# Altium schematic sheet SolarPowerBank.SchDoc
size A3; SheetNumber: 1; SheetTotal: 1
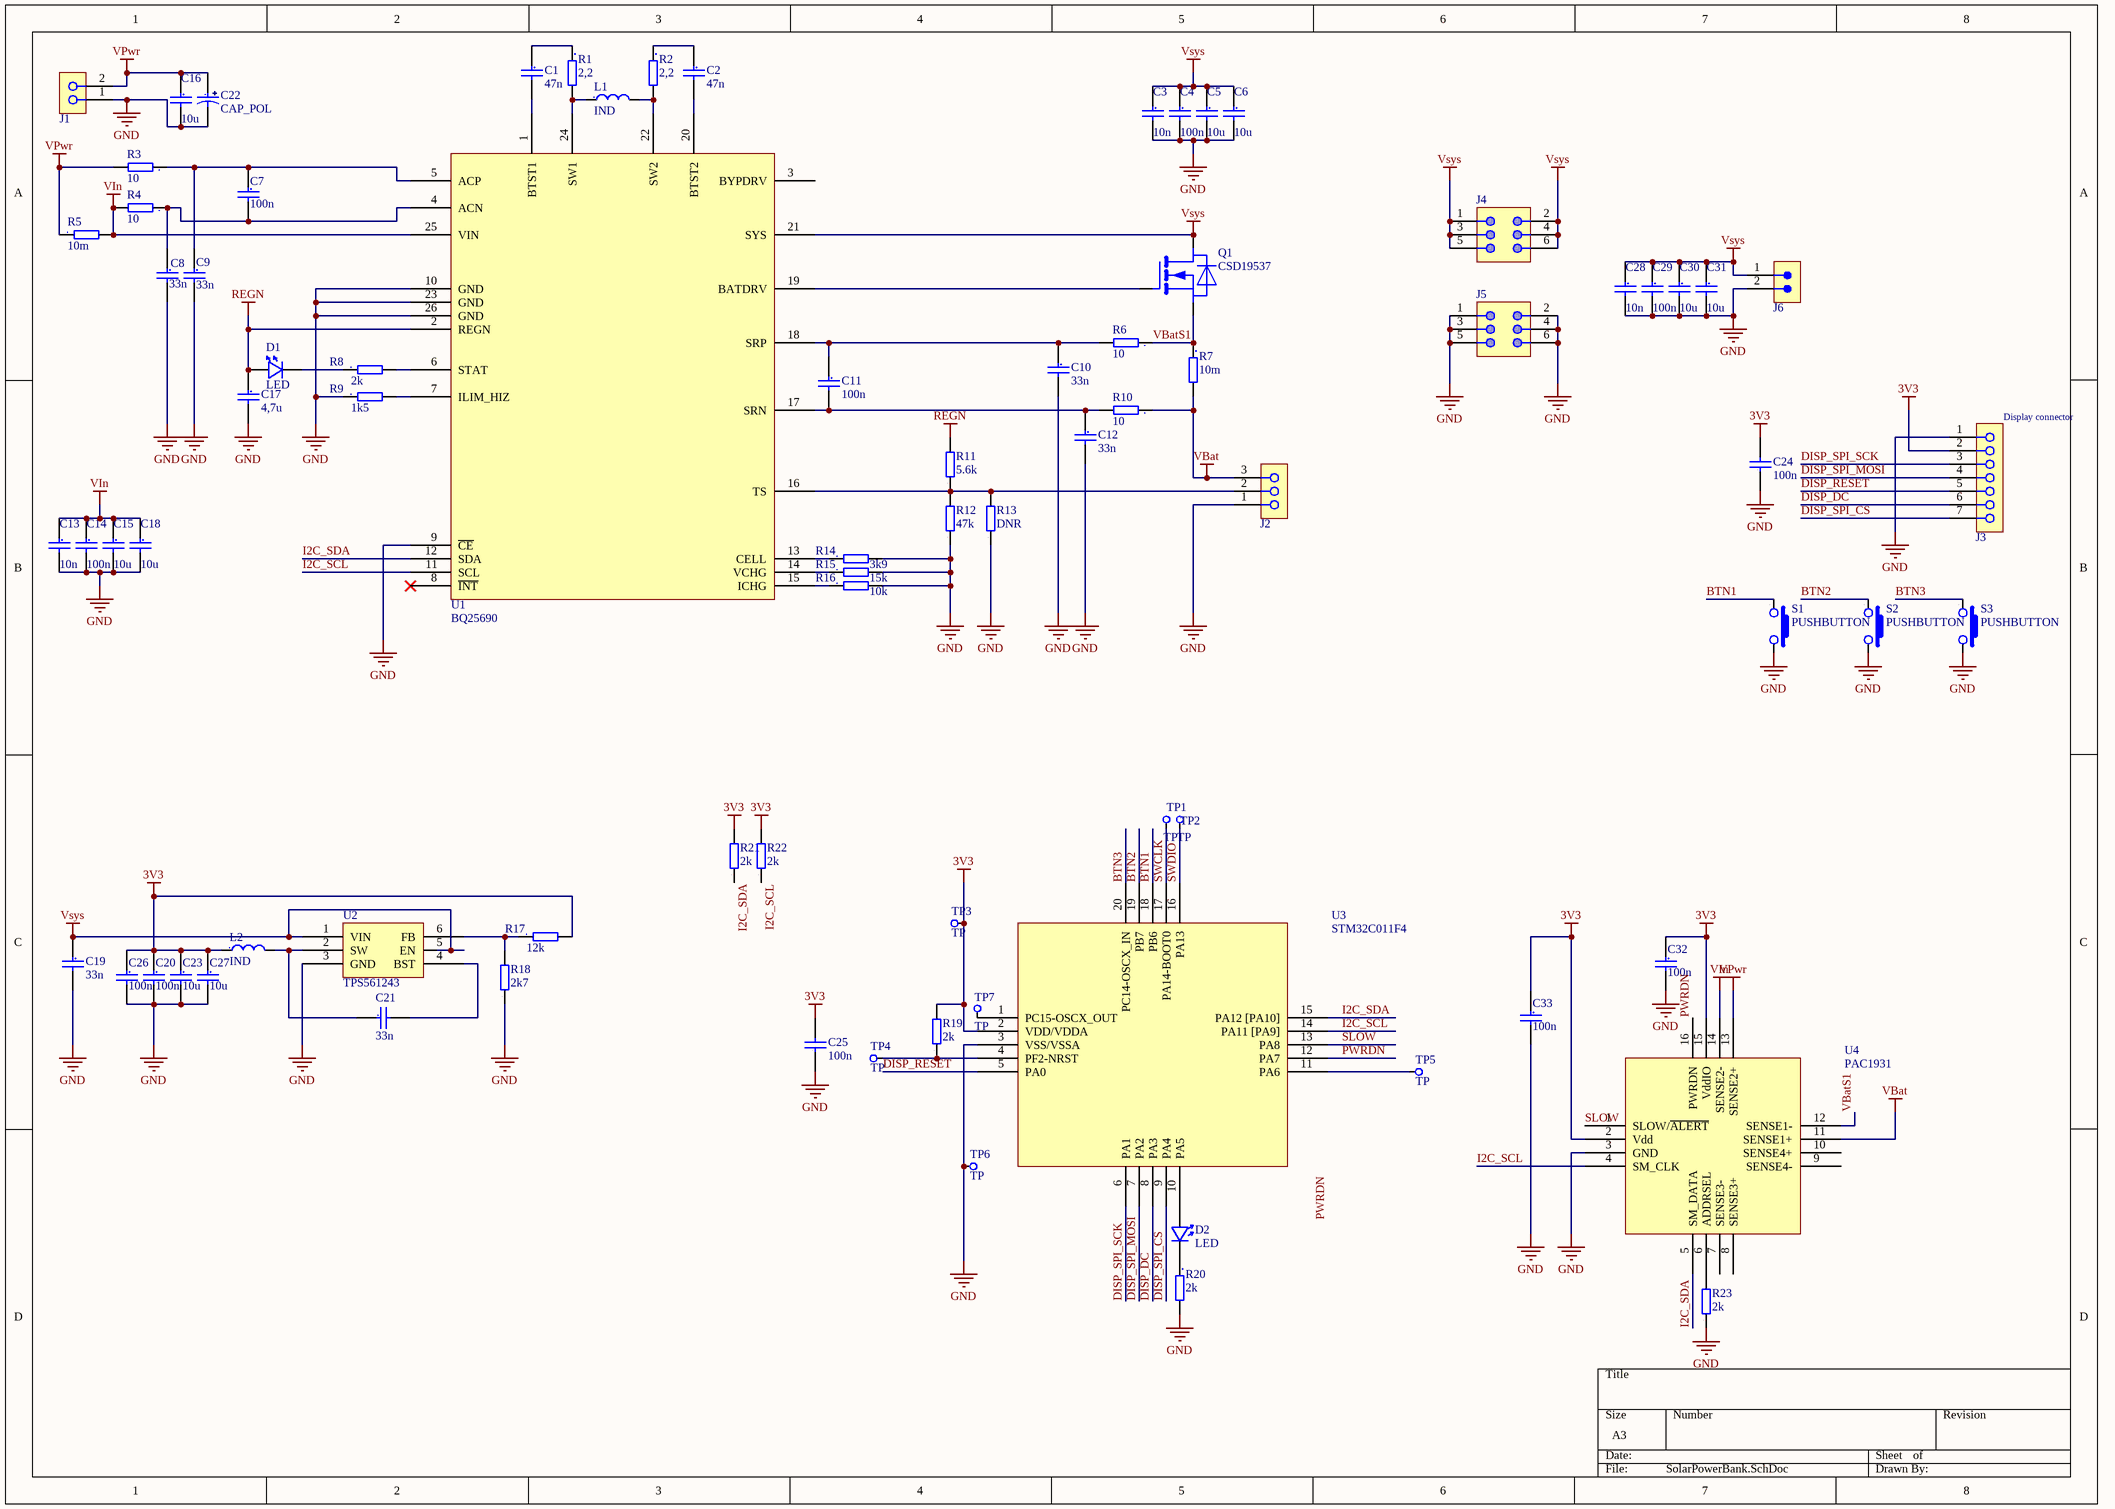
[diagram p0: SolarPowerBank.SchDoc]

## Parts
C1  47n  [C0402_N]
C2  47n  [C0402_N]
C3  10n  [C0805_N]
C4  100n  [C0805_N]
C5  10u  [C0805_N]
C6  10u  [C0805_N]
C7  100n  [C0402_N]
C8  33n  [C0402_N]
C9  33n  [C0402_N]
C10  33n  [C0603_N]
C11  100n  [C0402_N]
C12  33n  [C0603_N]
C13  10n  [C0805_N]
C14  100n  [C0805_N]
C15  10u  [C0805_N]
C16  10u  [C0805_N]
C17  4,7u  [C0402_N]
C18  10u  [C0805_N]
C19  33n  [C0402_N]
C20  100n  [C0402_N]
C21  33n  [C0402_N]
C22  CAP_POL  [C592D_D]
C23  10u  [C0603_N]
C24  100n  [C0402_N]
C25  100n  [C0402_N]
C26  100n  [C0402_N]
C27  10u  [C0603_N]
C28  10n  [C0805_N]
C29  100n  [C0805_N]
C30  10u  [C0805_N]
C31  10u  [C0805_N]
C32  100n  [C0402_N]
C33  100n  [C0402_N]
D1  LED  [LED_0603]
D2  LED  [LED_0603]
J1  (no value)  [TERM_BLOCK_2x1]
J2  (no value)  [TERM_BLOCK_CONNECTOR_3x1]
J3  Display connector  [PINSOCK_7X1_THT]
J4  (no value)  [PINHDR_3X2_THT_2,54]
J5  (no value)  [PINHDR_3X2_THT_2,54]
J6  (no value)  [S2B-XH-A-1]
L1  IND  [SNR5040]
L2  IND  [IND_2520]
Q1  CSD19537  [PowerPAK]
R1  2,2  [R0402_N]
R2  2,2  [R0402_N]
R3  10  [R0402_N]
R4  10  [R0402_N]
R5  10m  [R2512_Wide]
R6  10  [R0402_N]
R7  10m  [R2512_Wide]
R8  2k  [R0402_N]
R9  1k5  [R0402_N]
R10  10  [R0402_N]
R11  5.6k  [R0402_N]
R12  47k  [R0402_N]
R13  DNR  [R0402_N]
R14  3k9  [R0402_N]
R15  15k  [R0402_N]
R16  10k  [R0402_N]
R17  12k  [R0402_N]
R18  2k7  [R0402_N]
R19  2k  [R0402_N]
R20  2k  [R0402_N]
R21  2k  [R0402_N]
R22  2k  [R0402_N]
R23  2k  [R0402_N]
S1  PUSHBUTTON  [DTSM-3]
S2  PUSHBUTTON  [DTSM-3]
S3  PUSHBUTTON  [DTSM-3]
TP1  TP  [TP_1MM]  (no BOM)
TP2  TP  [TP_1MM]  (no BOM)
TP3  TP  [TP_1MM]  (no BOM)
TP4  TP  [TP_1MM]  (no BOM)
TP5  TP  [TP_1MM]  (no BOM)
TP6  TP  [TP_1MM]  (no BOM)
TP7  TP  [TP_1MM]  (no BOM)
U1  BQ25690  [WQFN-HR-26]
U2  TPS561243  [SOT-563]
U3  STM32C011F4  [UFQFPN20]
U4  PAC1931  [UQFN-16]

## Nets
3V3: C20.1 C23.1 C24.2 C25.2 C26.1 C27.1 C32.1 C33.1 J3.2 L2.1 R17.2 R19.2 R21.2 R22.2 TP3.1 U3.2(VDD/VDDA) U4.2(Vdd) U4.15(VddIO)
GND: C3.2 C4.2 C5.2 C6.2 C8.2 C9.2 C10.2 C12.2 C13.2 C14.2 C15.2 C16.2 C17.2 C18.2 C19.2 C20.2 C22.N C23.2 C24.1 C25.1 C26.2 C27.2 C28.2 C29.2 C30.2 C31.2 C32.2 C33.2 J1.1 J2.1 J3.1 J5.1 J5.2 J5.3 J5.4 J5.5 J5.6 J6.2 R9.1 R12.1 R13.1 R14.2 R15.2 R16.2 R18.1 R20.2 R23.1 S1.2 S2.2 S3.2 TP6.1 U1.9(~{CE}) U1.10(GND) U1.23(GND) U1.26(GND) U2.3(GND) U3.3(VSS/VSSA) U4.3(GND)
REGN: C17.1 D1.A R11.2 U1.2(REGN)
VBat: J2.3 R7.2 R10.1 U4.11(SENSE1+)
VIn: C13.1 C14.1 C15.1 C18.1 R4.2 R5.2 U1.25(VIN) U4.14(SENSE2-)
VPwr: C16.1 C22.P J1.2 R3.2 R5.1 U4.13(SENSE2+)
Vsys: C3.1 C4.1 C5.1 C6.1 C19.1 C28.1 C29.1 C30.1 C31.1 J4.1 J4.2 J4.3 J4.4 J4.5 J4.6 J6.1 Q1.D U1.21(SYS) U2.1(VIN) U2.5(EN)
BTN1: S1.1 U3.18(PB6)
BTN2: S2.1 U3.19(PB7)
BTN3: S3.1 U3.20(PC14-OSCX_IN)
DISP_DC: J3.6 U3.8(PA3)
DISP_RESET: J3.5 U3.5(PA0)
DISP_SPI_CS: J3.7 U3.9(PA4)
DISP_SPI_MOSI: J3.4 U3.7(PA2)
DISP_SPI_SCK: J3.3 U3.6(PA1)
I2C_SCL: R22.1 U1.11(SCL) U3.14(PA11_[PA9]) U4.4(SM_CLK)
I2C_SDA: R21.1 U1.12(SDA) U3.15(PA12_[PA10]) U4.5(SM_DATA)
PWRDN: U3.12(PA7) U4.16(PWRDN)
SLOW: U3.13(PA8) U4.1(SLOW/~{ALERT})
SWCLK: TP1.1 U3.17(PA14-BOOT0)
SWDIO: TP2.1 U3.16(PA13)
VBatS1: Q1.S R6.1 R7.1 U4.12(SENSE1-)
NetC1_1: C1.1 R1.1
NetC1_2: C1.2 U1.1(BTST1)
NetC2_1: C2.1 R2.1
NetC2_2: C2.2 U1.20(BTST2)
NetC7_1: C7.1 C9.1 R3.1 U1.5(ACP)
NetC7_2: C7.2 C8.1 R4.1 U1.4(ACN)
NetC10_1: C10.1 C11.1 R6.2 U1.18(SRP)
NetC11_2: C11.2 C12.1 R10.2 U1.17(SRN)
NetC21_1: C21.1 L2.2 U2.2(SW)
NetC21_2: C21.2 U2.4(BST)
NetD1_K: D1.K R8.1
NetD2_A: D2.A U3.10(PA5)
NetD2_K: D2.K R20.1
NetJ2_2: J2.2 R11.1 R12.2 R13.2 U1.16(TS)
NetL1_1: L1.1 R1.2 U1.24(SW1)
NetL1_2: L1.2 R2.2 U1.22(SW2)
NetQ1_G: Q1.G U1.19(BATDRV)
NetR8_2: R8.2 U1.6(STAT)
NetR9_2: R9.2 U1.7(ILIM_HIZ)
NetR14_1: R14.1 U1.13(CELL)
NetR15_1: R15.1 U1.14(VCHG)
NetR16_1: R16.1 U1.15(ICHG)
NetR17_1: R17.1 R18.2 U2.6(FB)
NetR19_1: R19.1 TP4.1 U3.4(PF2-NRST)
NetR23_2: R23.2 U4.6(ADDRSEL)
NetTP5_1: TP5.1 U3.11(PA6)
NetTP7_1: TP7.1 U3.1(PC15-OSCX_OUT)

Not connected (* = marked no-connect by the designer): U1 3(BYPDRV) 8(~{INT})*; U4 7(SENSE3-) 8(SENSE3+) 9(SENSE4-) 10(SENSE4+)

## Notes on the sheet
- Labels drawn without touching a wire or pin: PWRDN

## Library data of the parts
C1-C21 C23-C33 = CAP: RevS: $Rev:: 58        $
C22 = CAP_POL: RevS: $Rev:: 58        $
J1 = SOCHDR_2X1: Socket; ComponentLink1Description: Manufacturer; ComponentLink1URL: http://www.we-online.de; ComponentLink2Description: Datasheet; ComponentLink2URL: http://katalog.we-online.de/em/datasheet/691412320002.pdf
J2 = SOCHDR_3X1: Socket; ComponentLink1Description: Manufacturer; ComponentLink1URL: http://www.we-online.de; ComponentLink2Description: Datasheet; ComponentLink2URL: http://katalog.we-online.de/em/datasheet/691412320002.pdf
J3 = SOCHDR_7X1: Socket; ComponentLink1Description: Manufacturer; ComponentLink1URL: http://www.we-online.de; ComponentLink2Description: Datasheet; ComponentLink2URL: http://katalog.we-online.de/em/datasheet/691412320002.pdf
J4 J5 = PINHDR_3x2
J6 = PINHDR_2X1: Socket; ComponentLink1Description: Manufacturer; ComponentLink1URL: http://www.we-online.de; ComponentLink2Description: Datasheet; ComponentLink2URL: http://katalog.we-online.de/em/datasheet/691412320002.pdf
L1 L2 = IND: Inductor
Q1 = MOSFET_N
R1-R23 = RES
U1 = BQ25690: Standalone/I2C Controlled, 34V, 1- to 7-Cell Li-Ion, 3A Buck-Boost Bidirectional NVDC Battery Charger with Bypass Mode and USB-PD OTG Output
U3 = MCU_STM32C011F4